# Altium project Motor_35.PrjPcb
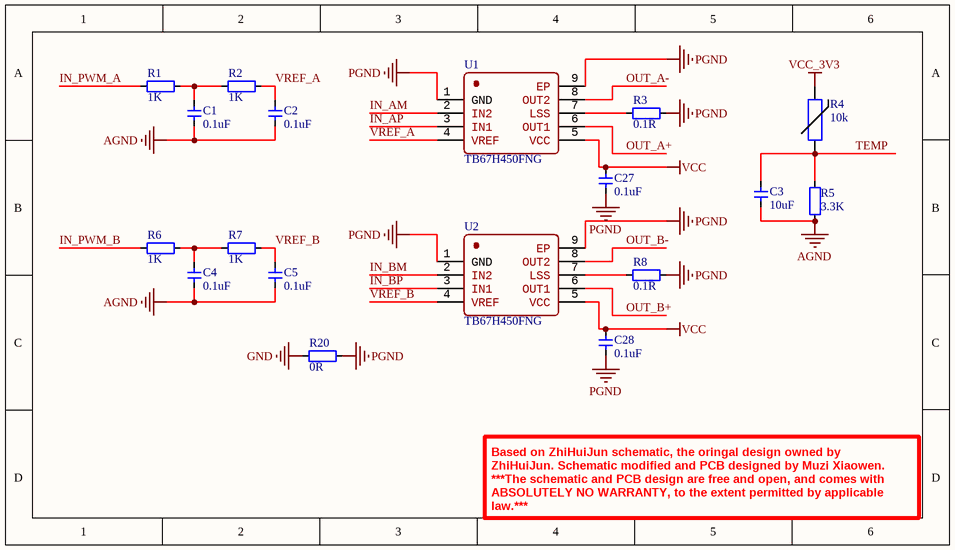
[diagram p0: Drive.SchDoc]
5 sheets, 74 parts. Net scope: global (net labels, ports and power ports of the same name join across sheets).
Board file: Motor-35.PcbDoc
Sheets:
  Drive.SchDoc
  Interface.SchDoc
  MCU.SchDoc
  Port.SchDoc
  Power.SchDoc

## Sheet Drive.SchDoc
size 177 x 101 mm; SheetNumber: 1; SheetTotal: 1

### Parts
C1  0.1uF  [CAP_0402]
C2  0.1uF  [CAP_0402]
C3  10uF  [CAP_0402]
C4  0.1uF  [CAP_0402]
C5  0.1uF  [CAP_0402]
C27  0.1uF  [CAP_0402]
C28  0.1uF  [CAP_0402]
R1  1K  [RES_0402]
R2  1K  [RES_0402]
R3  0.1R  [1206-RES]
R4  value 10k  [RES_0402]  (hidden comment: NCP15XH103F03RC)
R5  3.3K  [RES_0402]
R6  1K  [RES_0402]
R7  1K  [RES_0402]
R8  0.1R  [1206-RES]
R20  0R  [1206-RES]
U1  TB67H450FNG  [SO-8-PAD]
U2  TB67H450FNG  [SO-8-PAD]

### Nets
AGND: C1.1 C2.1 C3.1 C4.1 C5.1 R5.1
GND: R20.1
PGND: C27.1 C28.1 R3.2 R8.2 R20.2 U1.1(GND) U1.9(EP) U2.1(GND) U2.9(EP)
VCC: C27.2 C28.2 U1.5(VCC) U2.5(VCC)
VCC_3V3: R4.2
IN_AM: U1.2(IN2)
IN_AP: U1.3(IN1)
IN_BM: U2.2(IN2)
IN_BP: U2.3(IN1)
IN_PWM_A: R1.1
IN_PWM_B: R6.1
OUT_A+: U1.6(OUT1)
OUT_A-: U1.8(OUT2)
OUT_B+: U2.6(OUT1)
OUT_B-: U2.8(OUT2)
TEMP: C3.2 R4.1 R5.2
VREF_A: C2.2 R2.2 U1.4(VREF)
VREF_B: C5.2 R7.2 U2.4(VREF)
NetC1_2: C1.2 R1.2 R2.1
NetC4_2: C4.2 R6.2 R7.1
NetR3_1: R3.1 U1.7(LSS)
NetR8_1: R8.1 U2.7(LSS)

### Notes on the sheet
- Based on ZhiHuiJun schematic, the oringal design owned by ZhiHuiJun. Schematic modified and PCB designed by Muzi Xiaowen. ***The schematic and PCB design are free and open, and comes with ABSOLUTELY NO WARRANTY, to the extent permitted by applicable law.***

### Library data of the parts
C1-C5 C27 C28 = 电容-0402: Capacitor; Value: 0.1u
R1 R2 R5-R7 = 电阻-0402: Resistor; Value: 22R
R3 R8 = 电阻-1206: Resistor; Value: 22R
R4 = NCP15XH103F03RC: THERMISTOR 10K OHM NTC 0402 SMD
R20 = 电阻-1206: Resistor; Value: 0R
U1 U2 = TB67H450FNG: PWM Chopper Type DC Brushed Motor Driver

## Sheet Interface.SchDoc
size 203 x 165 mm; SheetNumber: 1; SheetTotal: 1
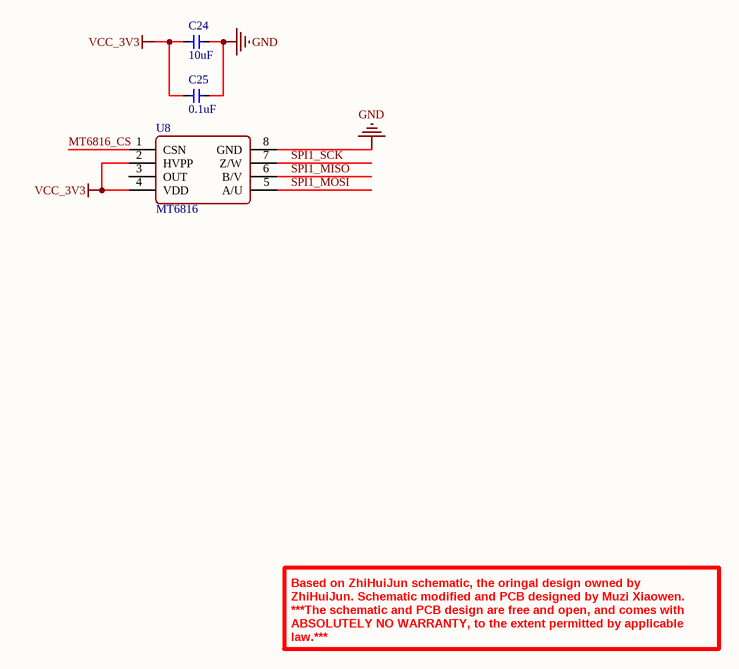
[diagram p1: Interface.SchDoc]

### Parts
C24  10uF  [CAP_0402]
C25  0.1uF  [CAP_0402]
U8  MT6816  [SO-8]

### Nets
GND: C24.1 C25.1 U8.8(GND)
VCC_3V3: C24.2 C25.2 U8.2(HVPP) U8.4(VDD)
MT6816_CS: U8.1(CSN)
SPI1_MISO: U8.6(B/V)
SPI1_MOSI: U8.5(A/U)
SPI1_SCK: U8.7(Z/W)

Not connected (* = marked no-connect by the designer): U8 3(OUT)

### Notes on the sheet
- Based on ZhiHuiJun schematic, the oringal design owned by ZhiHuiJun. Schematic modified and PCB designed by Muzi Xiaowen. ***The schematic and PCB design are free and open, and comes with ABSOLUTELY NO WARRANTY, to the extent permitted by applicable law.***

### Library data of the parts
C24 C25 = 电容-0402: Capacitor; Value: 0.1u
U8 = MT6816: Magnetic Position Sensor

## Sheet MCU.SchDoc
size 177 x 114 mm; SheetNumber: 1; SheetTotal: 1
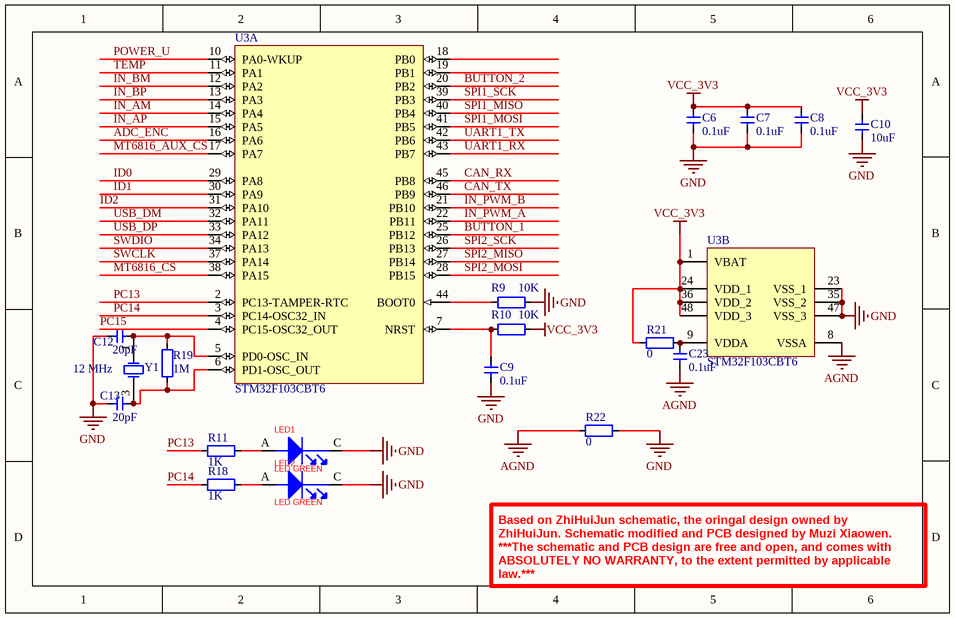
[diagram p2: MCU.SchDoc]

### Parts
C6  0.1uF  [CAP_0402]
C7  0.1uF  [CAP_0402]
C8  0.1uF  [CAP_0402]
C9  0.1uF  [CAP_0402]
C10  10uF  [CAP_0402]
C12  20pF  [CAP_0402]
C13  20pF  [CAP_0402]
C23  0.1uF  [CAP_0402]
LED1  LED GREEN  [LED-0603]
LED2  LED GREEN  [LED-0603]
R9  10K  [RES_0402]
R10  10K  [RES_0402]
R11  1K  [RES_0402]
R18  1K  [RES_0402]
R19  1M  [RES_0402]
R21  0  [RES_0402]
R22  0  [RES_0402]
U3  STM32F103CBT6  [LQFP-48]  (parts A,B of 2)
Y1  value 12 MHz  [LC-SMD-3225_4P]  (hidden comment: XTAL-4)

### Nets
AGND: C23.1 R22.2 U3.8(VSSA)
GND: C6.1 C7.1 C8.1 C9.1 C10.1 C12.2 C13.2 LED1.C(CATHODE) LED2.C(CATHODE) R9.2 R22.1 U3.23(VSS_1) U3.35(VSS_2) U3.47(VSS_3)
VCC_3V3: C6.2 C7.2 C8.2 C10.2 R10.2 R21.2 U3.1(VBAT) U3.24(VDD_1) U3.36(VDD_2) U3.48(VDD_3)
ADC_ENC: U3.16(PA6)
BUTTON_1: U3.25(PB12)
BUTTON_2: U3.20(PB2)
CAN_RX: U3.45(PB8)
CAN_TX: U3.46(PB9)
ID0: U3.29(PA8)
ID1: U3.30(PA9)
ID2: U3.31(PA10)
IN_AM: U3.14(PA4)
IN_AP: U3.15(PA5)
IN_BM: U3.12(PA2)
IN_BP: U3.13(PA3)
IN_PWM_A: U3.22(PB11)
IN_PWM_B: U3.21(PB10)
MT6816_AUX_CS: U3.17(PA7)
MT6816_CS: U3.38(PA15)
PC13: R11.1 U3.2(PC13-TAMPER-RTC)
PC14: R18.1 U3.3(PC14-OSC32_IN)
PC15: U3.4(PC15-OSC32_OUT)
POWER_U: U3.10(PA0-WKUP)
SPI1_MISO: U3.40(PB4)
SPI1_MOSI: U3.41(PB5)
SPI1_SCK: U3.39(PB3)
SPI2_MISO: U3.27(PB14)
SPI2_MOSI: U3.28(PB15)
SPI2_SCK: U3.26(PB13)
SWCLK: U3.37(PA14)
SWDIO: U3.34(PA13)
TEMP: U3.11(PA1)
UART1_RX: U3.43(PB7)
UART1_TX: U3.42(PB6)
USB_DM: U3.32(PA11)
USB_DP: U3.33(PA12)
NetC9_2: C9.2 R10.1 U3.7(NRST)
NetC12_1: C12.1 R19.2 U3.5(PD0-OSC_IN) Y1.1(OSC1)
NetC13_1: C13.1 R19.1 U3.6(PD1-OSC_OUT) Y1.3(OSC2)
NetC23_2: C23.2 R21.1 U3.9(VDDA)
NetLED1_A: LED1.A(ANODE) R11.2
NetLED2_A: LED2.A(ANODE) R18.2
NetR9_1: R9.1 U3.44(BOOT0)

Not connected (* = marked no-connect by the designer): U3 18(PB0) 19(PB1)

### Notes on the sheet
- Based on ZhiHuiJun schematic, the oringal design owned by ZhiHuiJun. Schematic modified and PCB designed by Muzi Xiaowen. ***The schematic and PCB design are free and open, and comes with ABSOLUTELY NO WARRANTY, to the extent permitted by applicable law.***

### Library data of the parts
C6-C10 C23 = 电容-0402: Capacitor; Value: 0.1u
C12 C13 = 电容-0402: Capacitor; Value: 20pF
LED1 LED2 = LED: LED GRN SGL RA 25mA 4.1V SMD; CLASS: IC; CAD_APPROVED: Yes; MFG_PN01: AA4040ZGS; MFG_NAME01: Kingbright; AGILE_PN: 370-76642; PN: 19-217/G7C-AN1P2/3T; HEIGHT: 4.25MM; ROHS: Yes
R9-R11 R18 R19 = 电阻-0402: Resistor; Value: 22R
R21 R22 = 电阻-0402: Resistor; Value: 0R
U3 = STM32F103CBT6: ARM Cortex-M3 32-bit MCU, 128 KB Flash, 20 KB Internal RAM, 37 I/Os, 48-pin LQFP, -40 to 85 degC, Tray; A/D Converter: 2x12-bit (10 Channel); FLASH Size (Prog) (kB): 128; I/Os (High Current): 37; Internal RAM Size (kB): 20; Operating Frequency(F) (Processor speed) (MHz): 72; Supply Voltage(Vcc) min (V): 2; DatasheetVersion: Rev. 16; PackageVersion: Rev. 6, 06/2013; PackageReference: LQFP48; PackageDescription: 48-Pin Low Profile Quad Flat Package, 7 x 7 mm Body, 0.5 mm Pitch; Supplier 1: Digi-Key; Supplier Part Number 1: 497-6288-ND; Supplier 2: Farnell; Supplier Part Number 2: 1606327; Supplier 3: Newark; Supplier Part Number 3: 11N8296; Supplier 4: Newark; Supplier Part Number 4: 57P1214; Supplier 5: Mouser; Supplier Part Number 5: 511-STM32F103CBT6; Core: ARM Cortex-M3; Packing: Tray; Mounting Technology: Surface Mount; PartNumber: STM32F103CBT6; ComponentLink1Description: Manufacturer URL; ComponentLink1URL: http://www.st.com/web/en/home.html; ComponentLink2Description: Datasheet; ComponentLink2URL: http://www.st.com/st-web-ui/static/active/en/resource/technical/document/datasheet/CD00161566.pdf; ComponentLink3Description: Package Specification; ComponentLink3URL: http://www.st.com/st-web-ui/static/active/en/resource/technical/document/datasheet/DM00058181.pdf
Y1 = XTAL-4: Crystal; Parameters: 20ppm 20pF -20/+70C; Manufacturer: *; Distributors: Comet; Price: 0.238

## Sheet Port.SchDoc
size 177 x 165 mm; SheetNumber: 1; SheetTotal: 1; SPICEModelCacheZMLSMFEG: <root> / <DocumentId>ZMLSMFEG</DocumentId> / </root>
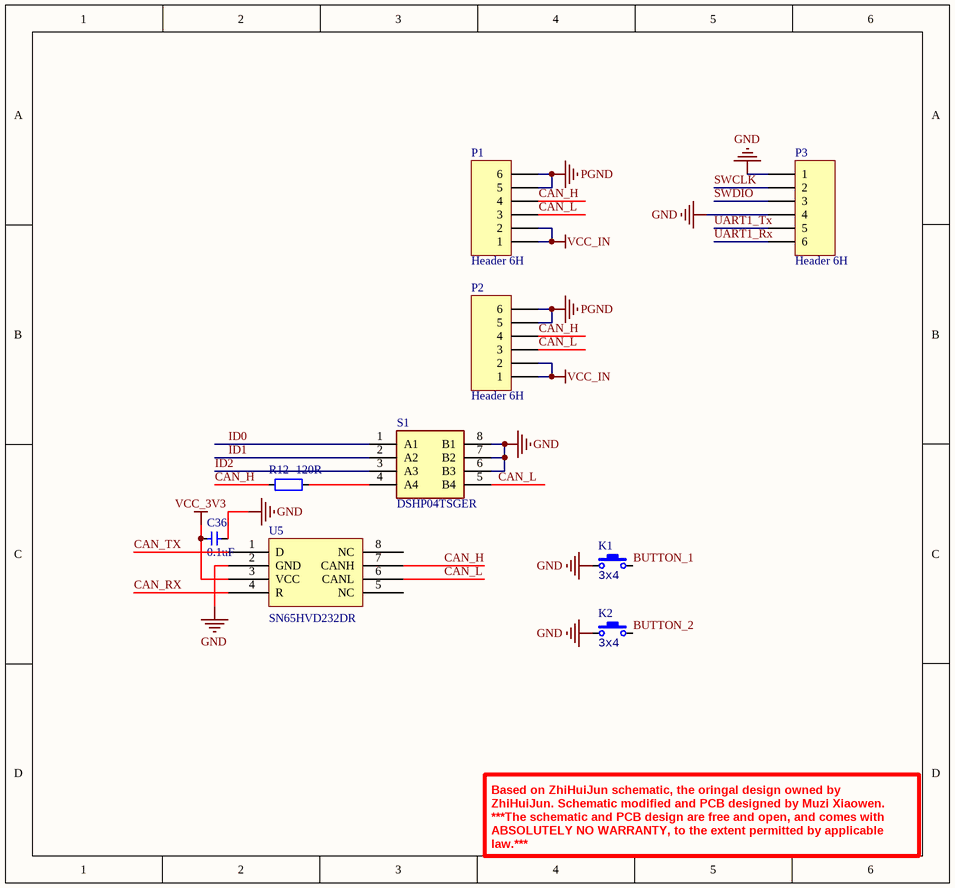
[diagram p3: Port.SchDoc]

### Parts
C36  0.1uF  [CAP_0402]
K1  value 3x4  [ButtonTACT_3x4x2_180]  (hidden comment: TACT 2P)
K2  value 3x4  [ButtonTACT_3x4x2_180]  (hidden comment: TACT 2P)
P1  Header 6H  [CONN-TH_HC-ZH1.5-6A-s]
P2  Header 6H  [CONN-TH_HC-ZH1.5-6A-s]
P3  Header 6H  [CONN-TH_HC-ZH1.5-6A-s]
R12  120R  [RES_0402]
S1  DSHP04TSGER  [SW-SMD_DSHP04TS-S]
U5  Manufacturer Part Number: SN65HVD232DR  [so-8]  (hidden comment: SN65HVD232D)

### Nets
GND: C36.1 K1.1 K2.1 P3.1 P3.4 S1.6(B3) S1.7(B2) S1.8(B1) U5.2(GND)
PGND: P1.5 P1.6 P2.5 P2.6
VCC_3V3: C36.2 U5.3(VCC)
VCC_IN: P1.1 P1.2 P2.1 P2.2
BUTTON_1: K1.2
BUTTON_2: K2.2
CAN_H: P1.4 P2.4 R12.1 U5.7(CANH)
CAN_L: P1.3 P2.3 S1.5(B4) U5.6(CANL)
CAN_RX: U5.4(R)
CAN_TX: U5.1(D)
ID0: S1.1(A1)
ID1: S1.2(A2)
ID2: S1.3(A3)
SWCLK: P3.2
SWDIO: P3.3
UART1_RX: P3.6
UART1_TX: P3.5
NetR12_2: R12.2 S1.4(A4)

Not connected (* = marked no-connect by the designer): U5 5(NC) 8(NC)

### Notes on the sheet
- Based on ZhiHuiJun schematic, the oringal design owned by ZhiHuiJun. Schematic modified and PCB designed by Muzi Xiaowen. ***The schematic and PCB design are free and open, and comes with ABSOLUTELY NO WARRANTY, to the extent permitted by applicable law.***

### Library data of the parts
C36 = 电容-0402: Capacitor; Value: 0.1u
K1 K2 = ButtonTACT_3x4x2_180: Button; type: TACT 2P
P1-P3 = Header 6H: Header, 6-Pin, Right Angle; LatestRevisionDate: 17-Jul-2002; LatestRevisionNote: Re-released for DXP Platform.; Publisher: Altium Limited
R12 = 电阻-0402: Resistor; Value: 22R
S1 = 218-4LPSTJ: DIP Switches / SIP Switches 4 pos. low profile Btm Seal Tape J Bend; Manufacturer_Name: CTS; Geometry.Height: 2.7mm; Mouser Part Number: 774-218-4LPSTJ; Mouser Price/Stock: https://www.mouser.co.uk/ProductDetail/CTS-Electronic-Components/218-4LPSTJ?qs=qNzHFtQhdJ%2Frpuf7cnHHWA%3D%3D; Manufacturer_Part_Number: 218-4LPSTJ; Datasheet Link: https://www.ctscorp.com/wp-content/uploads/218.pdf
U5 = SN65HVD232D: Manufacturer: Texas Instruments; Protocol: CAN; Number of Drivers/Receivers: 1/1; Duplex: Half; Data Rate: 1Mbps; Voltage - Supply: 3 V ~ 3.6 V; Supplier 1: Digi-Key; Supplier Part Number 1: 296-26344-2-ND; RoHS: RoHS Compliant; Category: Integrated Circuits (ICs); Stock: 5000; Pricing 1: 2500=0.84375 (USD); Packaging: Tape & Reel (TR); Part Status: Active; Type: Transceiver; Operating Temperature: -40°C ~ 85°C; Mounting Type: Surface Mount; Package / Case: 8-SOIC (0.154", 3.90mm Width); Supplier Device Package: 8-SOIC; ComponentLink1URL: http://www.ti.com/lit/ds/symlink/sn65hvd230.pdf; ComponentLink1Description: http://www.ti.com/lit/ds/symlink/sn65hvd230.pdf; Supplier 2: Digi-Key; Supplier Part Number 2: 296-26344-1-ND; Pricing 2: 1=2.05, 10=1.842, 100=1.4809, 500=1.21668, 1000=1.00811 (USD)

## Sheet Power.SchDoc
size 127 x 165 mm; SheetNumber: 1; SheetTotal: 1
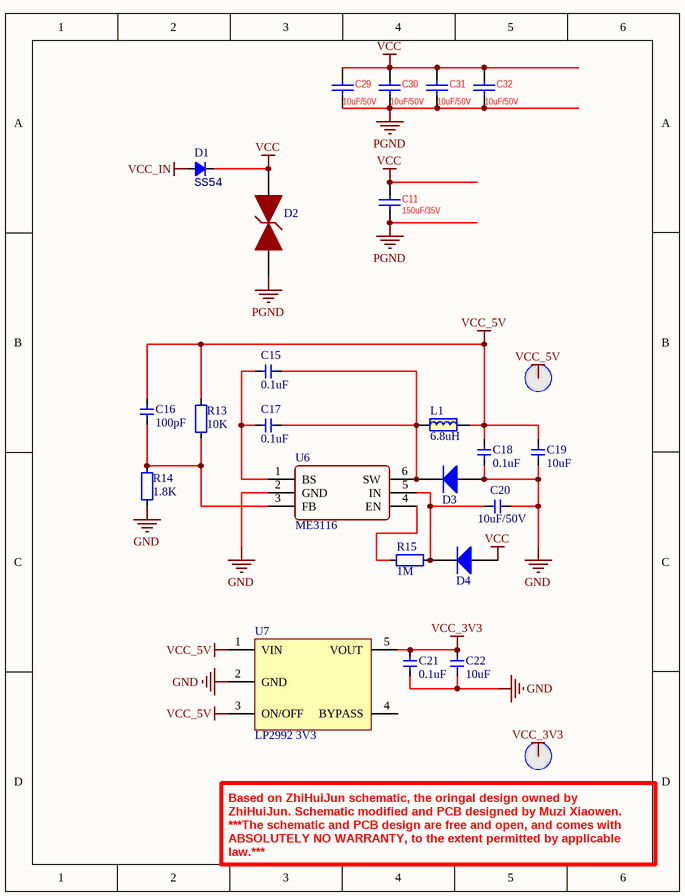
[diagram p4: Power.SchDoc]

### Parts
C11  value 150uF/35V  [CAP-SMD_BD8.0-L8.3-W8.3-LS9.3-FD]  (hidden comment: 220uF/25V)
C15  0.1uF  [CAP_0402]
C16  100pF  [CAP_0402]
C17  0.1uF  [CAP_0402]
C18  0.1uF  [CAP_0402]
C19  10uF  [CAP_0402]
C20  10uF/50V  [1206-CAP]
C21  0.1uF  [CAP_0402]
C22  10uF  [CAP_0402]
C29  10uF/50V  [1206-CAP]
C30  10uF/50V  [1206-CAP]
C31  10uF/50V  [1206-CAP]
C32  10uF/50V  [1206-CAP]
D1  SS54  [DO-214AC]
D2  SMBJ28CA  [SMBJ-CA_MFG]  (value not drawn)
D3  二极管-5819W  [SOD-323]  (value not drawn)
D4  二极管-5819W  [SOD-323]  (value not drawn)
L1  6.8uH  [IND-201612]
R13  10K  [RES_0402]
R14  1.8K  [RES_0402]
R15  1M  [RES_0402]
T1  测试点  [TEST_PT]  (value not drawn)
T2  测试点  [TEST_PT]  (value not drawn)
U6  ME3116  [SOT23-6]
U7  LP2992 3V3  [SOT23-5]

### Nets
GND: C18.1 C19.1 C20.1 C21.1 C22.1 D3.1(A) R14.1 U6.2(GND) U7.2(GND)
PGND: C11.2 C29.2 C30.2 C31.2 C32.2 D2.1
VCC: C11.1 C29.1 C30.1 C31.1 C32.1 D1.2(K) D2.2 D4.1(A)
VCC_3V3: C21.2 C22.2 T2.0 U7.5(VOUT)
VCC_5V: C16.1 C18.2 C19.2 L1.2 R13.2 T1.0 U7.1(VIN) U7.3(ON/OFF)
VCC_IN: D1.1(A)
NetC15_1: C15.1 C17.1 D3.2(K) L1.1 U6.6(SW)
NetC15_2: C15.2 C17.2 U6.1(BS)
NetC16_2: C16.2 R13.1 R14.2 U6.3(FB)
NetC20_2: C20.2 D4.2(K) R15.1 U6.5(IN)
NetR15_2: R15.2 U6.4(EN)

Not connected (* = marked no-connect by the designer): U7 4(BYPASS)

### Notes on the sheet
- (near T2) Based on ZhiHuiJun schematic, the oringal design owned by ZhiHuiJun. Schematic modified and PCB designed by Muzi Xiaowen. ***The schematic and PCB design are free and open, and comes with ABSOLUTELY NO WARRANTY, to the extent permitted by applicable law.***

### Library data of the parts
C11 C29-C32 = CAP: Capacitor, chip, ceramic; Parameters: E22 CAP; PN: RVT1E221M0607; Price: 0.038
  C29-C32: Value: 10uF/50V
C15-C22 = 电容-0402: Capacitor; Value: 0.1u
D1 = Diode_SMA: Diode; Type: SMA; Value: SS54
D3 D4 = 二极管-5819W: 40V
L1 = 电感-201612
R13-R15 = 电阻-0402: Resistor; Value: 22R
U6 = ME3116: DC-DC
U7 = LP2992: LDO

## Nets that join several sheets
AGND: Drive (6 pins), MCU (C23.1 R22.2 U3.8)
GND: Drive (R20.1), Interface (C24.1 C25.1 U8.8), MCU (14 pins), Port (9 pins), Power (9 pins)
PGND: Drive (9 pins), Port (P1.5 P1.6 P2.5 P2.6), Power (6 pins)
VCC: Drive (C27.2 C28.2 U1.5 U2.5), Power (8 pins)
VCC_3V3: Drive (R4.2), Interface (C24.2 C25.2 U8.2 U8.4), MCU (10 pins), Port (C36.2 U5.3), Power (C21.2 C22.2 T2.0 U7.5)
VCC_IN: Port (P1.1 P1.2 P2.1 P2.2), Power (D1.1)
BUTTON_1: MCU (U3.25), Port (K1.2)
BUTTON_2: MCU (U3.20), Port (K2.2)
CAN_RX: MCU (U3.45), Port (U5.4)
CAN_TX: MCU (U3.46), Port (U5.1)
ID0: MCU (U3.29), Port (S1.1)
ID1: MCU (U3.30), Port (S1.2)
ID2: MCU (U3.31), Port (S1.3)
IN_AM: Drive (U1.2), MCU (U3.14)
IN_AP: Drive (U1.3), MCU (U3.15)
IN_BM: Drive (U2.2), MCU (U3.12)
IN_BP: Drive (U2.3), MCU (U3.13)
IN_PWM_A: Drive (R1.1), MCU (U3.22)
IN_PWM_B: Drive (R6.1), MCU (U3.21)
MT6816_CS: Interface (U8.1), MCU (U3.38)
SPI1_MISO: Interface (U8.6), MCU (U3.40)
SPI1_MOSI: Interface (U8.5), MCU (U3.41)
SPI1_SCK: Interface (U8.7), MCU (U3.39)
SWCLK: MCU (U3.37), Port (P3.2)
SWDIO: MCU (U3.34), Port (P3.3)
TEMP: Drive (C3.2 R4.1 R5.2), MCU (U3.11)
UART1_RX: MCU (U3.43), Port (P3.6)
UART1_TX: MCU (U3.42), Port (P3.5)